# Altium schematic sheet Top_Sheet.SchDoc
size 420 x 297 mm; SheetNumber: 1; SheetTotal: 3
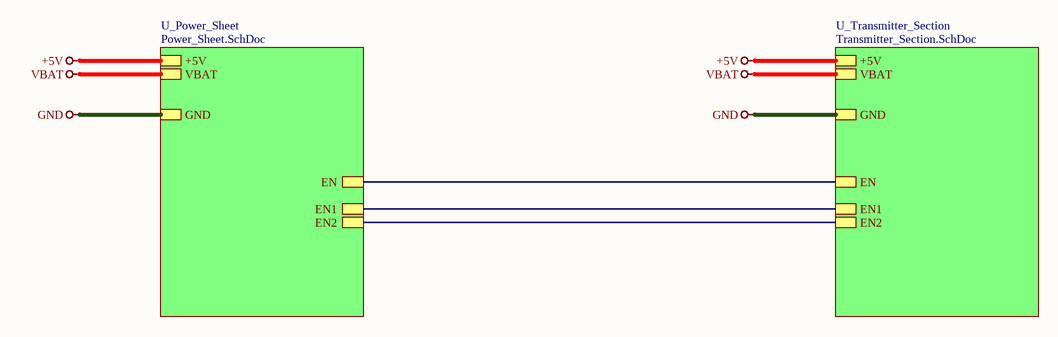
[diagram p0: Top_Sheet.SchDoc]

## Sub-sheets
U_Power_Sheet = Power_Sheet.SchDoc: VBAT, EN1, EN2, GND, EN, +5V
U_Transmitter_Section = Transmitter_Section.SchDoc: EN1, EN2, EN, VBAT, GND, +5V

## Nets
+5V: sheet U_Power_Sheet/+5V, sheet U_Transmitter_Section/+5V
GND: sheet U_Power_Sheet/GND, sheet U_Transmitter_Section/GND
VBAT: sheet U_Power_Sheet/VBAT, sheet U_Transmitter_Section/VBAT
(unnamed): sheet U_Power_Sheet/EN1, sheet U_Transmitter_Section/EN1
(unnamed): sheet U_Power_Sheet/EN2, sheet U_Transmitter_Section/EN2
(unnamed): sheet U_Power_Sheet/EN, sheet U_Transmitter_Section/EN

## Notes on the sheet
- File:
- Title:
- Date:
- Page
- Num:
- Total:
- Drawn By: Huzaifa Ali